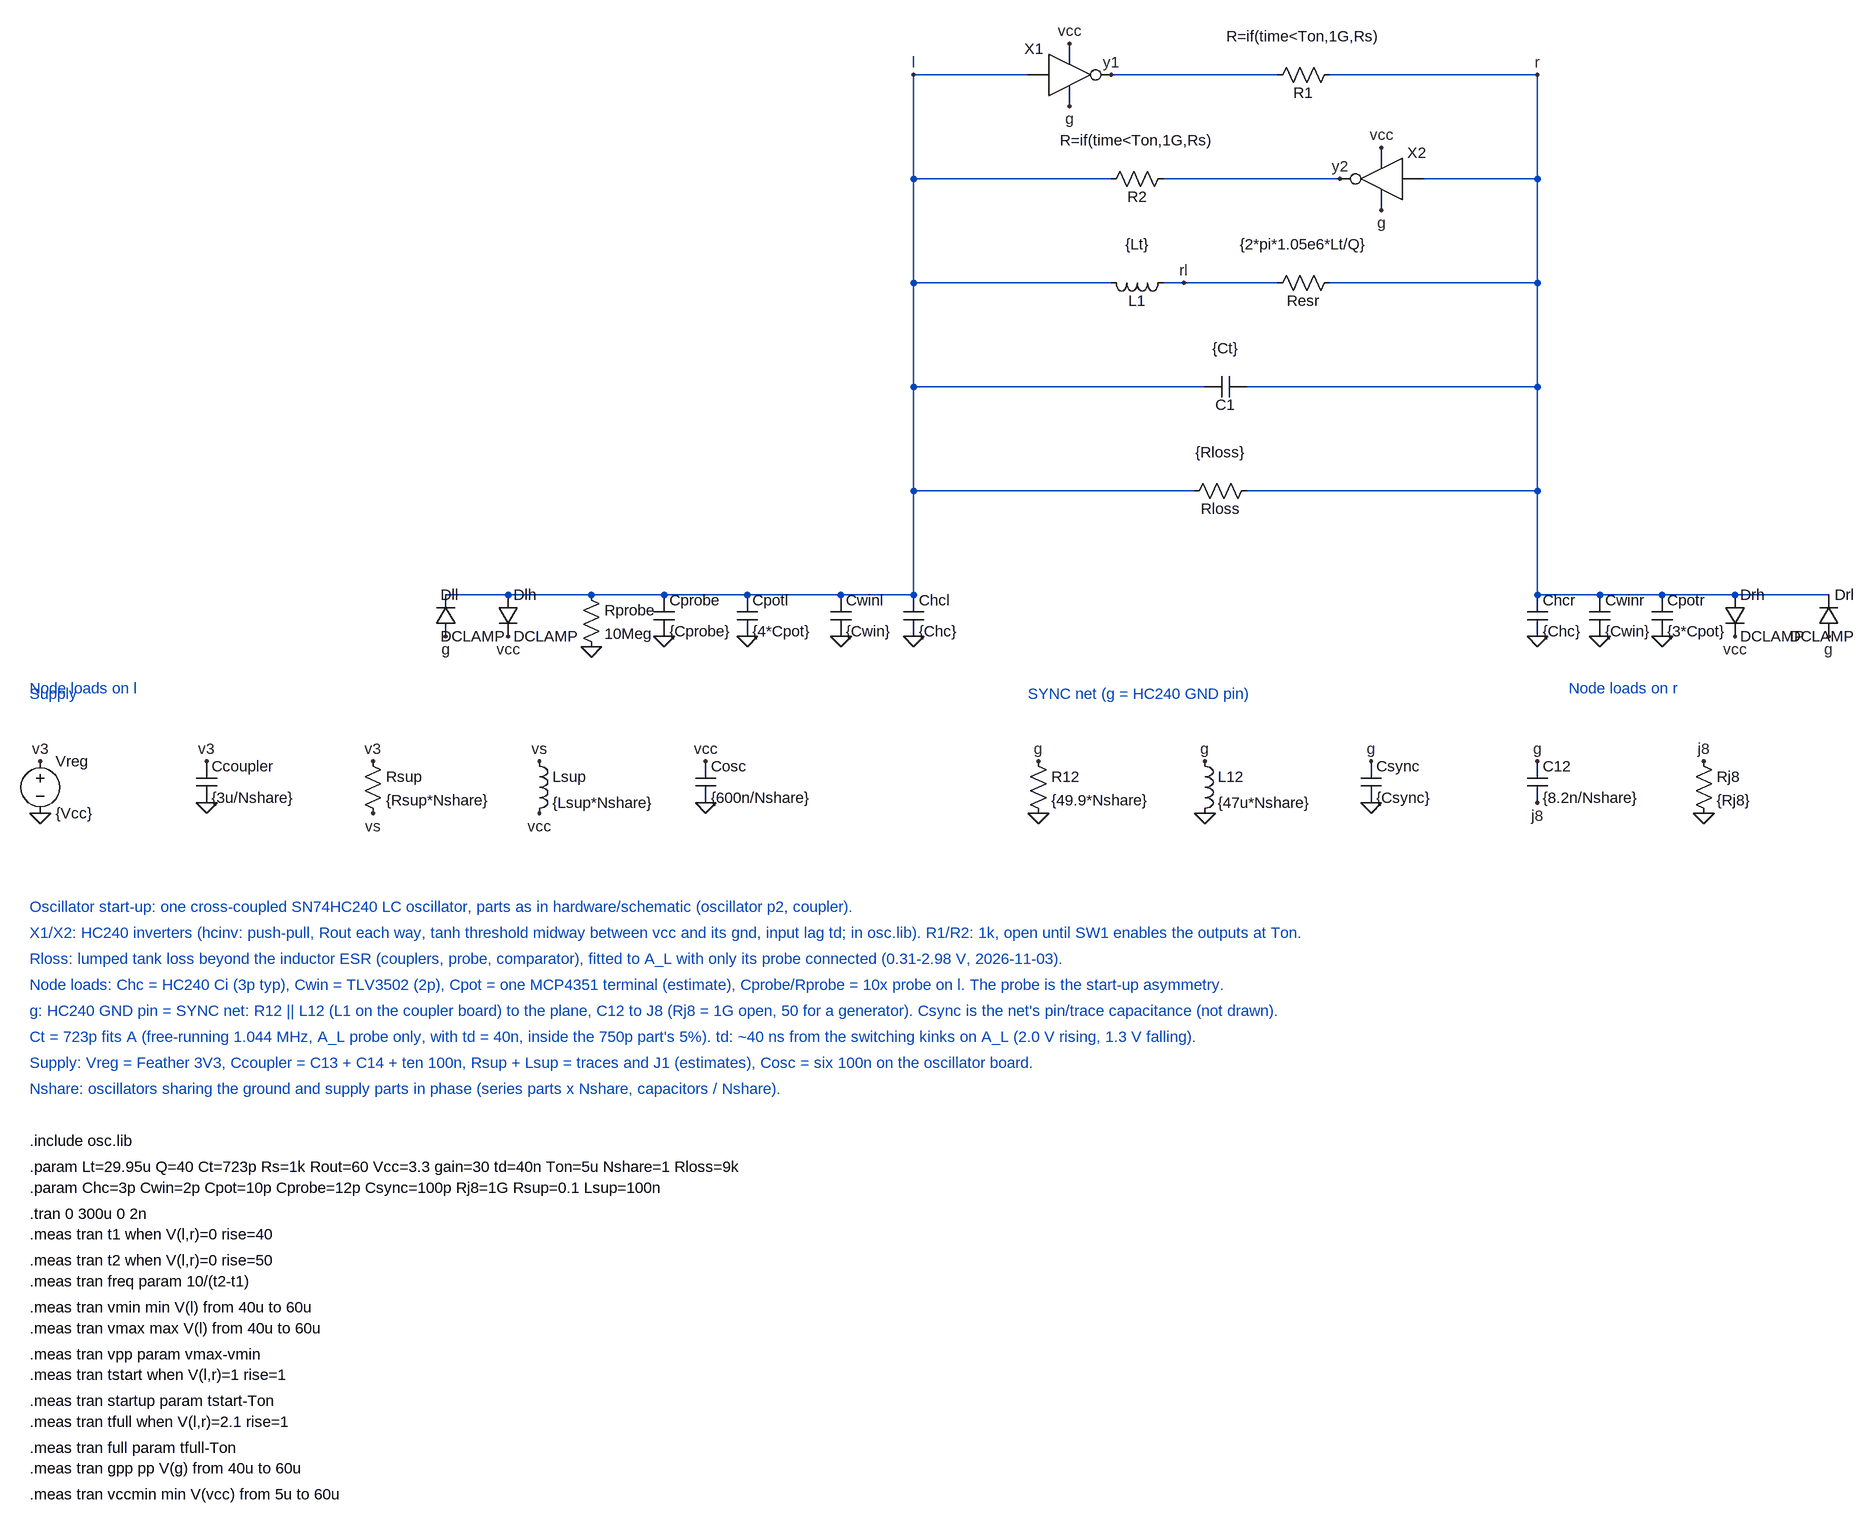
[diagram p0: schematic oscillator.asc]
oscillator.asc, the LTspice schematic file:
Version 4
SHEET 1 2600 2256
WIRE 176 0 0 0
WIRE 560 0 304 0
WIRE 960 0 640 0
WIRE 0 160 0 0
WIRE 304 160 0 160
WIRE 656 160 384 160
WIRE 960 160 960 0
WIRE 960 160 784 160
WIRE 0 320 0 160
WIRE 304 320 0 320
WIRE 416 320 384 320
WIRE 560 320 416 320
WIRE 960 320 960 160
WIRE 960 320 640 320
WIRE 0 480 0 320
WIRE 448 480 0 480
WIRE 960 480 960 320
WIRE 960 480 512 480
WIRE 0 640 0 480
WIRE 432 640 0 640
WIRE 960 640 960 480
WIRE 960 640 512 640
WIRE -624 800 -720 800
WIRE -496 800 -624 800
WIRE -384 800 -496 800
WIRE -256 800 -384 800
WIRE -112 800 -256 800
WIRE 0 800 0 640
WIRE 0 800 -112 800
WIRE 960 800 960 640
WIRE 1056 800 960 800
WIRE 1152 800 1056 800
WIRE 1264 800 1152 800
WIRE 1408 800 1264 800
FLAG 240 -48 vcc
FLAG 240 48 g
FLAG 304 0 y1
FLAG 720 112 vcc
FLAG 720 208 g
FLAG 656 160 y2
FLAG 416 320 rl
FLAG 0 0 l
FLAG 960 0 r
FLAG 0 864 0
FLAG -112 864 0
FLAG -256 864 0
FLAG -384 864 0
FLAG -496 880 0
FLAG -624 864 vcc
FLAG -720 864 g
FLAG 960 864 0
FLAG 1056 864 0
FLAG 1152 864 0
FLAG 1264 864 vcc
FLAG 1408 864 g
FLAG -1344 1056 v3
FLAG -1344 1136 0
FLAG -1088 1056 v3
FLAG -1088 1120 0
FLAG -832 1056 v3
FLAG -832 1136 vs
FLAG -576 1056 vs
FLAG -576 1136 vcc
FLAG -320 1056 vcc
FLAG -320 1120 0
FLAG 192 1056 g
FLAG 192 1136 0
FLAG 448 1056 g
FLAG 448 1136 0
FLAG 704 1056 g
FLAG 704 1120 0
FLAG 960 1056 g
FLAG 960 1120 j8
FLAG 1216 1056 j8
FLAG 1216 1136 0
SYMBOL hcinv 240 0 R0
WINDOW 0 -40 -40 Right 2
SYMATTR InstName X1
SYMBOL res 656 -16 R90
WINDOW 0 28 56 VTop 2
WINDOW 3 -28 56 VBottom 2
SYMATTR InstName R1
SYMATTR Value R=if(time<Ton,1G,Rs)
SYMBOL hcinv 720 160 M0
WINDOW 0 -40 -40 Right 2
SYMATTR InstName X2
SYMBOL res 400 144 R90
WINDOW 0 28 56 VTop 2
WINDOW 3 -28 56 VBottom 2
SYMATTR InstName R2
SYMATTR Value R=if(time<Ton,1G,Rs)
SYMBOL ind 400 304 R90
WINDOW 0 28 56 VTop 2
WINDOW 3 -28 56 VBottom 2
SYMATTR InstName L1
SYMATTR Value {Lt}
SYMBOL res 656 304 R90
WINDOW 0 28 56 VTop 2
WINDOW 3 -28 56 VBottom 2
SYMATTR InstName Resr
SYMATTR Value {2*pi*1.05e6*Lt/Q}
SYMBOL cap 512 464 R90
WINDOW 0 28 32 VTop 2
WINDOW 3 -28 32 VBottom 2
SYMATTR InstName C1
SYMATTR Value {Ct}
SYMBOL res 528 624 R90
WINDOW 0 28 56 VTop 2
WINDOW 3 -28 56 VBottom 2
SYMATTR InstName Rloss
SYMATTR Value {Rloss}
SYMBOL cap -16 800 R0
SYMATTR Value {Chc}
SYMATTR InstName Chcl
SYMBOL cap -128 800 R0
SYMATTR Value {Cwin}
SYMATTR InstName Cwinl
SYMBOL cap -272 800 R0
SYMATTR Value {4*Cpot}
SYMATTR InstName Cpotl
SYMBOL cap -400 800 R0
SYMATTR Value {Cprobe}
SYMATTR InstName Cprobe
SYMBOL res -512 784 R0
SYMATTR Value 10Meg
SYMATTR InstName Rprobe
SYMBOL diode -640 800 R0
SYMATTR Value DCLAMP
SYMATTR InstName Dlh
SYMBOL diode -704 864 R180
WINDOW 0 24 64 Right 2
WINDOW 3 24 0 Right 2
SYMATTR InstName Dll
SYMATTR Value DCLAMP
SYMBOL cap 944 800 R0
SYMATTR Value {Chc}
SYMATTR InstName Chcr
SYMBOL cap 1040 800 R0
SYMATTR Value {Cwin}
SYMATTR InstName Cwinr
SYMBOL cap 1136 800 R0
SYMATTR Value {3*Cpot}
SYMATTR InstName Cpotr
SYMBOL diode 1248 800 R0
SYMATTR Value DCLAMP
SYMATTR InstName Drh
SYMBOL diode 1424 864 R180
WINDOW 0 -24 64 Left 2
WINDOW 3 -24 0 Left 2
SYMATTR InstName Drl
SYMATTR Value DCLAMP
SYMBOL voltage -1344 1040 R0
SYMATTR Value {Vcc}
SYMATTR InstName Vreg
SYMBOL cap -1104 1056 R0
SYMATTR Value {3u/Nshare}
SYMATTR InstName Ccoupler
SYMBOL res -848 1040 R0
SYMATTR Value {Rsup*Nshare}
SYMATTR InstName Rsup
SYMBOL ind -592 1040 R0
SYMATTR Value {Lsup*Nshare}
SYMATTR InstName Lsup
SYMBOL cap -336 1056 R0
SYMATTR Value {600n/Nshare}
SYMATTR InstName Cosc
SYMBOL res 176 1040 R0
SYMATTR Value {49.9*Nshare}
SYMATTR InstName R12
SYMBOL ind 432 1040 R0
SYMATTR Value {47u*Nshare}
SYMATTR InstName L12
SYMBOL cap 688 1056 R0
SYMATTR Value {Csync}
SYMATTR InstName Csync
SYMBOL cap 944 1056 R0
SYMATTR Value {8.2n/Nshare}
SYMATTR InstName C12
SYMBOL res 1200 1040 R0
SYMATTR Value {Rj8}
SYMATTR InstName Rj8
TEXT -1360 944 Left 2 ;Node loads on l
TEXT 1008 944 Left 2 ;Node loads on r
TEXT -1360 952 Left 2 ;Supply
TEXT 176 952 Left 2 ;SYNC net (g = HC240 GND pin)
TEXT -1360 1280 Left 2 ;Oscillator start-up: one cross-coupled SN74HC240 LC oscillator, parts as in hardware/schematic (oscillator p2, coupler).
TEXT -1360 1320 Left 2 ;X1/X2: HC240 inverters (hcinv: push-pull, Rout each way, tanh threshold midway between vcc and its gnd, input lag td; in osc.lib). R1/R2: 1k, open until SW1 enables the outputs at Ton.
TEXT -1360 1360 Left 2 ;Rloss: lumped tank loss beyond the inductor ESR (couplers, probe, comparator), fitted to A_L with only its probe connected (0.31-2.98 V, 2026-11-03).
TEXT -1360 1400 Left 2 ;Node loads: Chc = HC240 Ci (3p typ), Cwin = TLV3502 (2p), Cpot = one MCP4351 terminal (estimate), Cprobe/Rprobe = 10x probe on l. The probe is the start-up asymmetry.
TEXT -1360 1440 Left 2 ;g: HC240 GND pin = SYNC net: R12 || L12 (L1 on the coupler board) to the plane, C12 to J8 (Rj8 = 1G open, 50 for a generator). Csync is the net's pin/trace capacitance (not drawn).
TEXT -1360 1480 Left 2 ;Ct = 723p fits A (free-running 1.044 MHz, A_L probe only, with td = 40n, inside the 750p part's 5%). td: ~40 ns from the switching kinks on A_L (2.0 V rising, 1.3 V falling).
TEXT -1360 1520 Left 2 ;Supply: Vreg = Feather 3V3, Ccoupler = C13 + C14 + ten 100n, Rsup + Lsup = traces and J1 (estimates), Cosc = six 100n on the oscillator board.
TEXT -1360 1560 Left 2 ;Nshare: oscillators sharing the ground and supply parts in phase (series parts x Nshare, capacitors / Nshare).
TEXT -1360 1640 Left 2 !.include osc.lib
TEXT -1360 1680 Left 2 !.param Lt=29.95u Q=40 Ct=723p Rs=1k Rout=60 Vcc=3.3 gain=30 td=40n Ton=5u Nshare=1 Rloss=9k
TEXT -1360 1712 Left 2 !.param Chc=3p Cwin=2p Cpot=10p Cprobe=12p Csync=100p Rj8=1G Rsup=0.1 Lsup=100n
TEXT -1360 1752 Left 2 !.tran 0 300u 0 2n
TEXT -1360 1784 Left 2 !.meas tran t1 when V(l,r)=0 rise=40
TEXT -1360 1824 Left 2 !.meas tran t2 when V(l,r)=0 rise=50
TEXT -1360 1856 Left 2 !.meas tran freq param 10/(t2-t1)
TEXT -1360 1896 Left 2 !.meas tran vmin min V(l) from 40u to 60u
TEXT -1360 1928 Left 2 !.meas tran vmax max V(l) from 40u to 60u
TEXT -1360 1968 Left 2 !.meas tran vpp param vmax-vmin
TEXT -1360 2000 Left 2 !.meas tran tstart when V(l,r)=1 rise=1
TEXT -1360 2040 Left 2 !.meas tran startup param tstart-Ton
TEXT -1360 2072 Left 2 !.meas tran tfull when V(l,r)=2.1 rise=1
TEXT -1360 2112 Left 2 !.meas tran full param tfull-Ton
TEXT -1360 2144 Left 2 !.meas tran gpp pp V(g) from 40u to 60u
TEXT -1360 2184 Left 2 !.meas tran vccmin min V(vcc) from 5u to 60u

The netlist it stands for:
* oscillator.asc
XX1 l y1 vcc g hcinv  ; pins in out vcc gnd
R1 r y1 R=if(time<Ton,1G,Rs)
XX2 r y2 vcc g hcinv  ; pins in out vcc gnd
R2 y2 l R=if(time<Ton,1G,Rs)
L1 rl l {Lt}
Resr r rl {2*pi*1.05e6*Lt/Q}
C1 r l {Ct}
Rloss r l {Rloss}
Chcl l 0 {Chc}
Cwinl l 0 {Cwin}
Cpotl l 0 {4*Cpot}
Cprobe l 0 {Cprobe}
Rprobe l 0 10Meg
Dlh l vcc DCLAMP
Dll g l DCLAMP
Chcr r 0 {Chc}
Cwinr r 0 {Cwin}
Cpotr r 0 {3*Cpot}
Drh r vcc DCLAMP
Drl g r DCLAMP
Vreg v3 0 {Vcc}
Ccoupler v3 0 {3u/Nshare}
Rsup v3 vs {Rsup*Nshare}
Lsup vs vcc {Lsup*Nshare}
Cosc vcc 0 {600n/Nshare}
R12 g 0 {49.9*Nshare}
L12 g 0 {47u*Nshare}
Csync g 0 {Csync}
C12 g j8 {8.2n/Nshare}
Rj8 j8 0 {Rj8}
.model D D
.lib standard.dio
* Node loads on l
* Node loads on r
* Supply
* SYNC net (g = HC240 GND pin)
* Oscillator start-up: one cross-coupled SN74HC240 LC oscillator, parts as in hardware/schematic (oscillator p2, coupler).
* X1/X2: HC240 inverters (hcinv: push-pull, Rout each way, tanh threshold midway between vcc and its gnd, input lag td; in osc.lib). R1/R2: 1k, open until SW1 enables the outputs at Ton.
* Rloss: lumped tank loss beyond the inductor ESR (couplers, probe, comparator), fitted to A_L with only its probe connected (0.31-2.98 V, 2026-11-03).
* Node loads: Chc = HC240 Ci (3p typ), Cwin = TLV3502 (2p), Cpot = one MCP4351 terminal (estimate), Cprobe/Rprobe = 10x probe on l. The probe is the start-up asymmetry.
* g: HC240 GND pin = SYNC net: R12 || L12 (L1 on the coupler board) to the plane, C12 to J8 (Rj8 = 1G open, 50 for a generator). Csync is the net's pin/trace capacitance (not drawn).
* Ct = 723p fits A (free-running 1.044 MHz, A_L probe only, with td = 40n, inside the 750p part's 5%). td: ~40 ns from the switching kinks on A_L (2.0 V rising, 1.3 V falling).
* Supply: Vreg = Feather 3V3, Ccoupler = C13 + C14 + ten 100n, Rsup + Lsup = traces and J1 (estimates), Cosc = six 100n on the oscillator board.
* Nshare: oscillators sharing the ground and supply parts in phase (series parts x Nshare, capacitors / Nshare).
.include osc.lib
.param Lt=29.95u Q=40 Ct=723p Rs=1k Rout=60 Vcc=3.3 gain=30 td=40n Ton=5u Nshare=1 Rloss=9k
.param Chc=3p Cwin=2p Cpot=10p Cprobe=12p Csync=100p Rj8=1G Rsup=0.1 Lsup=100n
.tran 0 300u 0 2n
.meas tran t1 when V(l,r)=0 rise=40
.meas tran t2 when V(l,r)=0 rise=50
.meas tran freq param 10/(t2-t1)
.meas tran vmin min V(l) from 40u to 60u
.meas tran vmax max V(l) from 40u to 60u
.meas tran vpp param vmax-vmin
.meas tran tstart when V(l,r)=1 rise=1
.meas tran startup param tstart-Ton
.meas tran tfull when V(l,r)=2.1 rise=1
.meas tran full param tfull-Ton
.meas tran gpp pp V(g) from 40u to 60u
.meas tran vccmin min V(vcc) from 5u to 60u
.backanno
.end